# EasyEDA Pro project usb-2.0-hub.epro

# Schematic Schematic1
Board Name: Board1; Create Date: 2025-09-09; Page Name: P1; Project Name: USB拓展坞（2.0）; Schematic Name: Schematic1; Update Date: 2025-09-09; Company: 嘉立创EDA; Page Size: A4; Version: V1.0
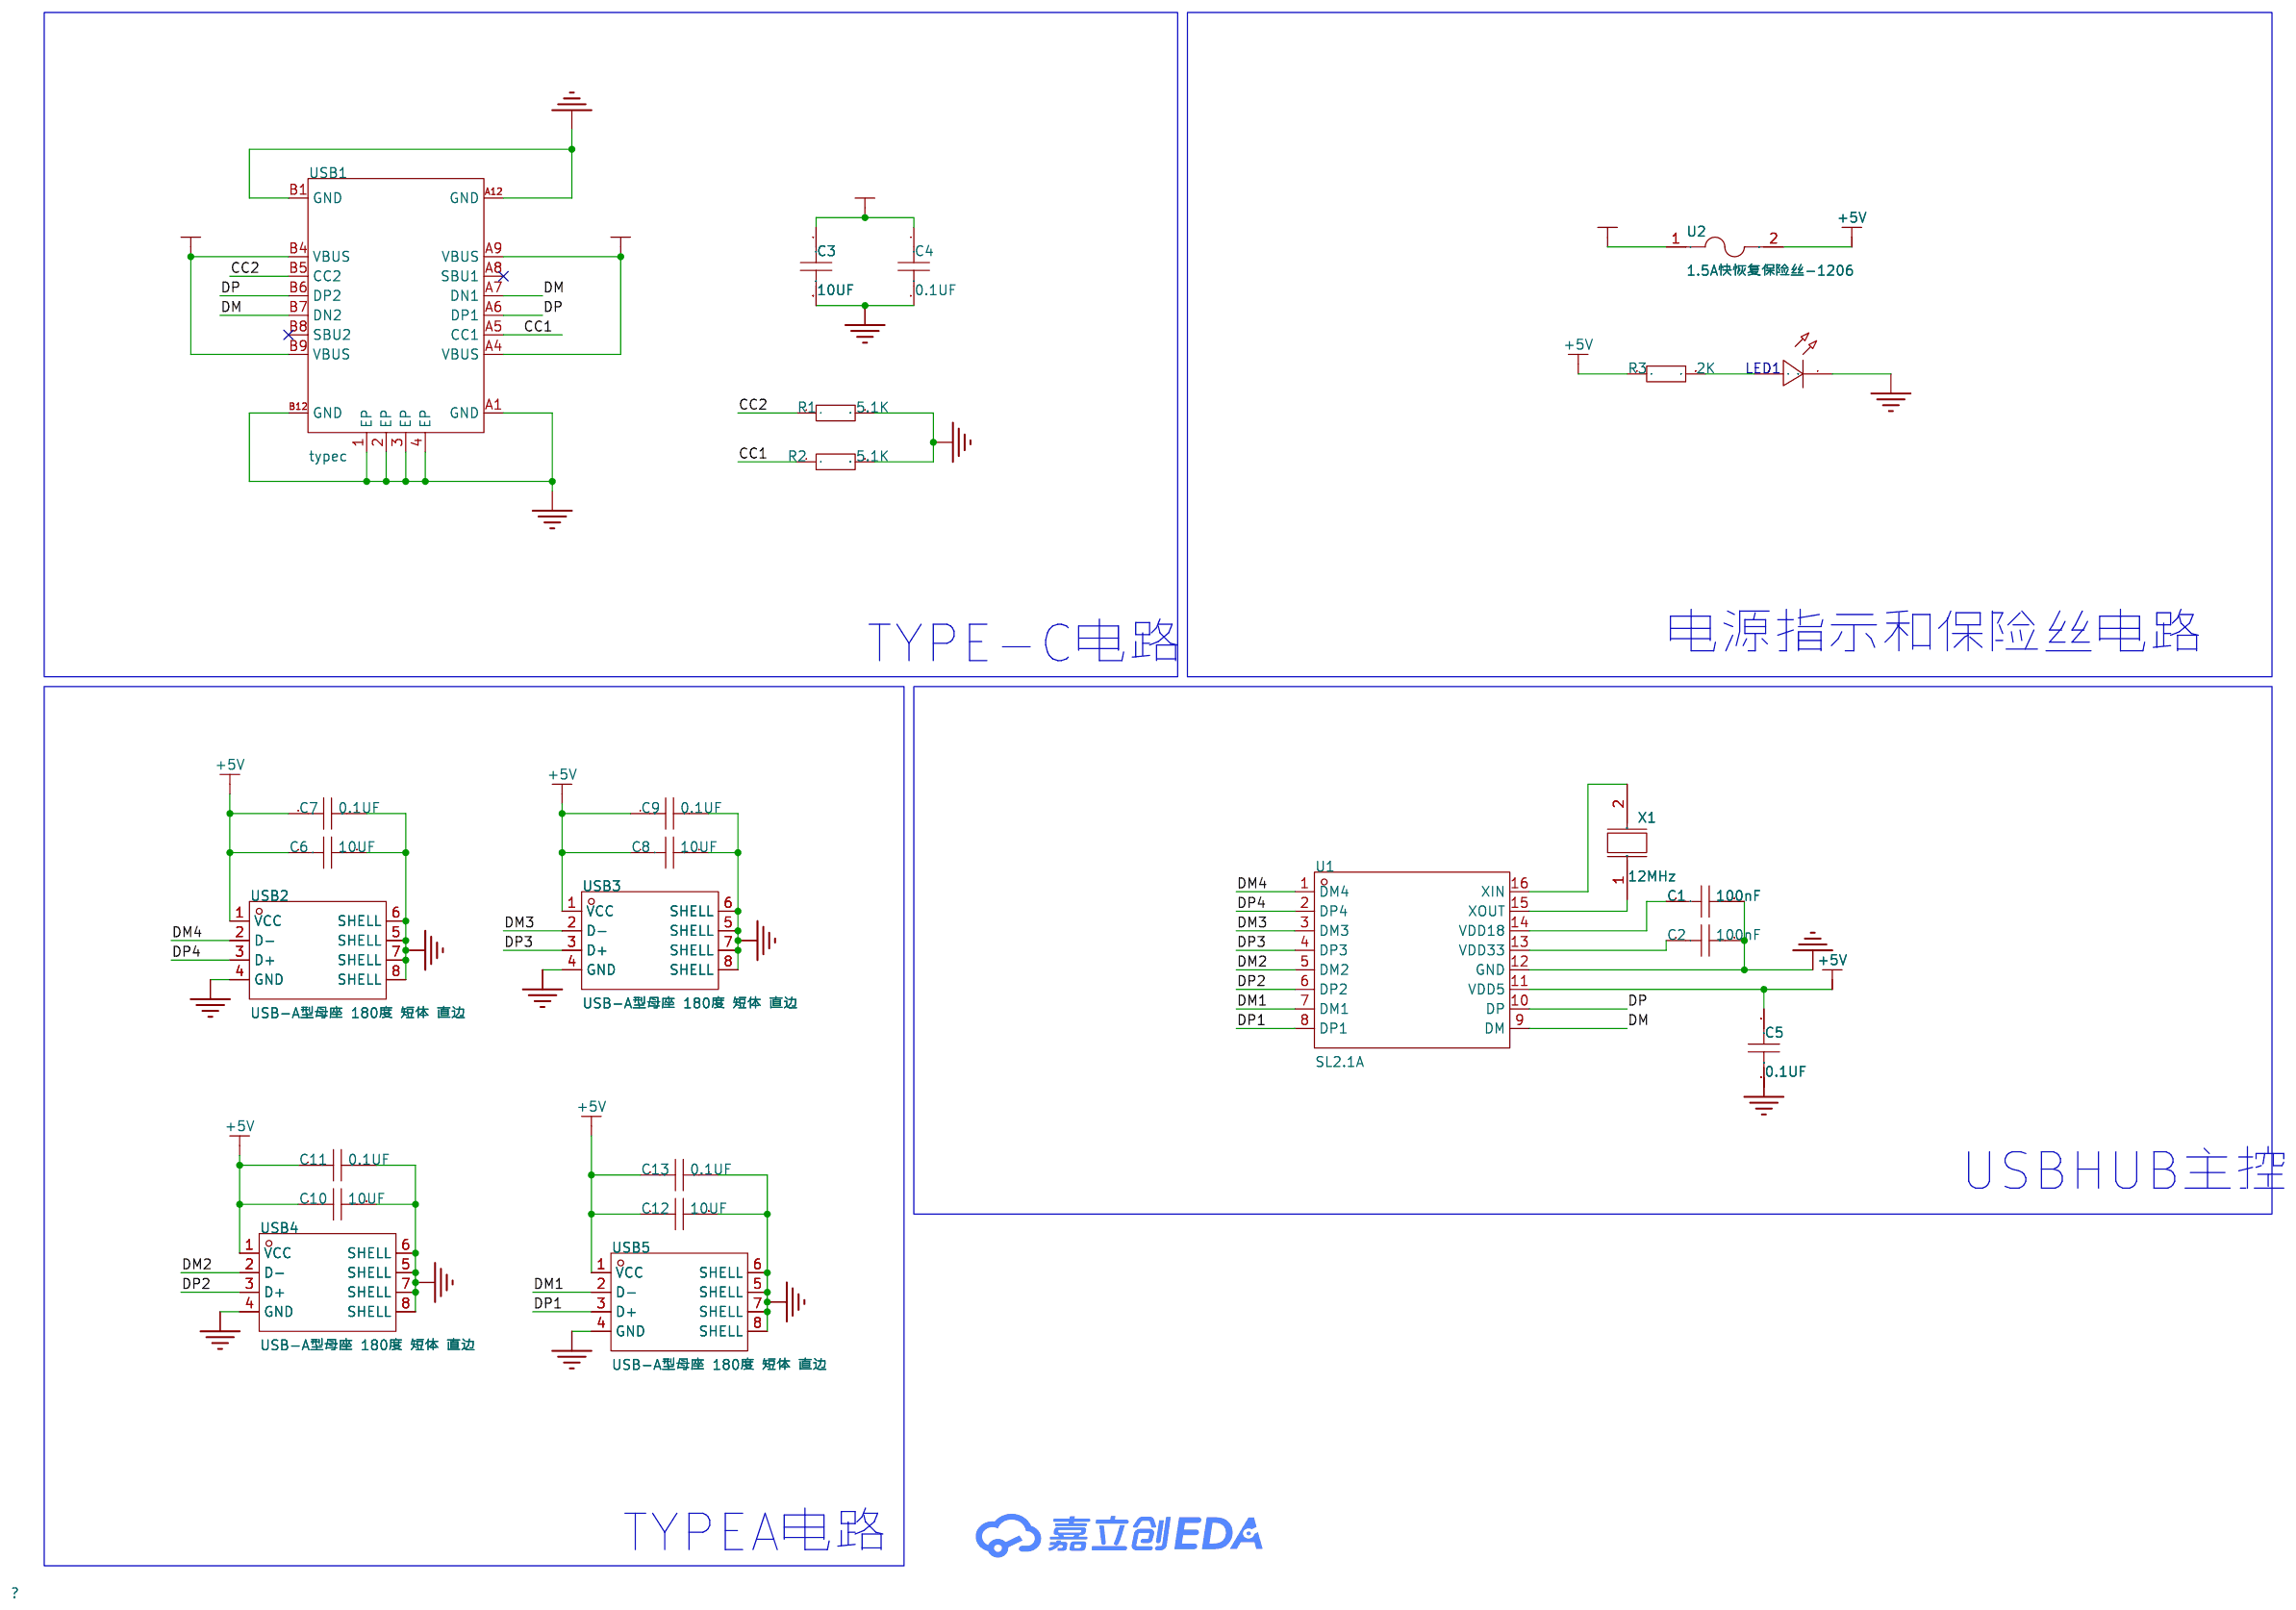
[diagram p0: schematic sheet]

## Parts
C1  100nF  [C0805]
C2  100nF  [C0805]
C3  10UF  [C0805]
C4  0.1UF  [C0805]
C5  0.1UF  [C0805]
C6  10UF  [C0805]
C7  0.1UF  [C0805]
C8  10UF  [C0805]
C9  0.1UF  [C0805]
C10  10UF  [C0805]
C11  0.1UF  [C0805]
C12  10UF  [C0805]
C13  0.1UF  [C0805]
LED1  -  [LED_0805]
R1  5.1K  [R0805]
R2  5.1K  [R0805]
R3  2K  [R0805]
U1  SL2.1A  [SOP-16_L10.0-W3.9-P1.27-LS6.0-BL]
U2  1.5A快恢复保险丝-1206  [F1206]
USB1  typec  [USB-C-SMD_KH-TYPE-C-16P]
USB2  USB-A型母座 180度 短体 直边  [USB-A-SMD_WT_C9900004571]
USB3  USB-A型母座 180度 短体 直边  [USB-A-SMD_WT_C9900004571]
USB4  USB-A型母座 180度 短体 直边  [USB-A-SMD_WT_C9900004571]
USB5  USB-A型母座 180度 短体 直边  [USB-A-SMD_WT_C9900004571]
X1  12MHz  [CRYSTAL-SMD_L5.0-W3.2-1-A]

## Library data of the parts
C1-C13 = CAP_0805: Supplier Footprint: 0805
LED1 = LED_0805-G: Supplier Footprint: 0805
R1-R3 = Res_0805: Supplier Footprint: 0805
U1 = SL2.1A: SL2.1A是一颗高集成度,高性能,低功耗的USB2.0集线器主控芯片，支持USB2.0高速(480MHz),全速(12MHz)和低速模式(1.5MHz)，内置12MHz晶体振荡器。; LCSC Part Name: USB2.0高速4端口HUB控制器; Supplier Part: C192893; Manufacturer: CoreChips(和芯润德); Supplier Footprint: SOP-16; JLCPCB Part Class: 扩展库; Datasheet: https://item.szlcsc.com/datasheet/SL2.1A/225853.html; Supplier: LCSC
U2 = 1.5A快恢复保险丝-1206: Supplier Part: C9900012139; JLCPCB Part Class: 扩展库; Supplier: LCSC
USB1 = typec: Supplier Part: C9900016956; Supplier Footprint: typec 12p; JLCPCB Part Class: 扩展库; Supplier: LCSC
USB2-USB5 = USB-A型母座 180度 短体 直边: Supplier Part: C9900004571; Supplier Footprint: SMD; JLCPCB Part Class: 扩展库; Supplier: LCSC
X1 = 12MHz: Supplier Part: C9900003079; Supplier Footprint: CRYSTAL5032-2P; JLCPCB Part Class: 扩展库; Supplier: LCSC

## Nets
+5V: C5.1 C6.1 C7.1 C8.1 C9.1 C10.1 C11.1 C12.1 C13.1 R3.1 U1.11(VDD5) U2.2 USB2.1(VCC) USB3.1(VCC) USB4.1(VCC) USB5.1(VCC)
GND: C1.2 C2.2 C3.2 C4.2 C5.2 C6.2 C7.2 C8.2 C9.2 C10.2 C11.2 C12.2 C13.2 LED1.1(C) R1.2 R2.2 U1.12(GND) USB1.1(EP) USB1.2(EP) USB1.3(EP) USB1.4(EP) USB1.A1(GND) USB1.A12(GND) USB1.B1(GND) USB1.B12(GND) USB2.4(GND) USB2.5(SHELL) USB2.6(SHELL) USB2.7(SHELL) USB2.8(SHELL) USB3.4(GND) USB3.5(SHELL) USB3.6(SHELL) USB3.7(SHELL) USB3.8(SHELL) USB4.4(GND) USB4.5(SHELL) USB4.6(SHELL) USB4.7(SHELL) USB4.8(SHELL) USB5.4(GND) USB5.5(SHELL) USB5.6(SHELL) USB5.7(SHELL) USB5.8(SHELL)
VCC+5V: C3.1 C4.1 U2.1 USB1.A4(VBUS) USB1.A9(VBUS) USB1.B4(VBUS) USB1.B9(VBUS)
CC1: R2.1 USB1.A5(CC1)
CC2: R1.1 USB1.B5(CC2)
DM: U1.9(DM) USB1.A7(DN1) USB1.B7(DN2)
DM1: U1.7(DM1) USB5.2(D-)
DM2: U1.5(DM2) USB4.2(D-)
DM3: U1.3(DM3) USB3.2(D-)
DM4: U1.1(DM4) USB2.2(D-)
DP: U1.10(DP) USB1.A6(DP1) USB1.B6(DP2)
DP1: U1.8(DP1) USB5.3(D+)
DP2: U1.6(DP2) USB4.3(D+)
DP3: U1.4(DP3) USB3.3(D+)
DP4: U1.2(DP4) USB2.3(D+)
$1N648: U1.16(XIN) X1.2
$1N652: U1.15(XOUT) X1.1
$1N656: C1.1 U1.14(VDD18)
$1N660: C2.1 U1.13(VDD33)
$1N2672: LED1.2(A) R3.2

Not connected (* = marked no-connect by the designer): USB1 A8(SBU1)* B8(SBU2)*

## Notes on the sheet
- TYPE-C电路
- 电源指示和保险丝电路
- USBHUB主控
- TYPEA电路

# Board PCB1
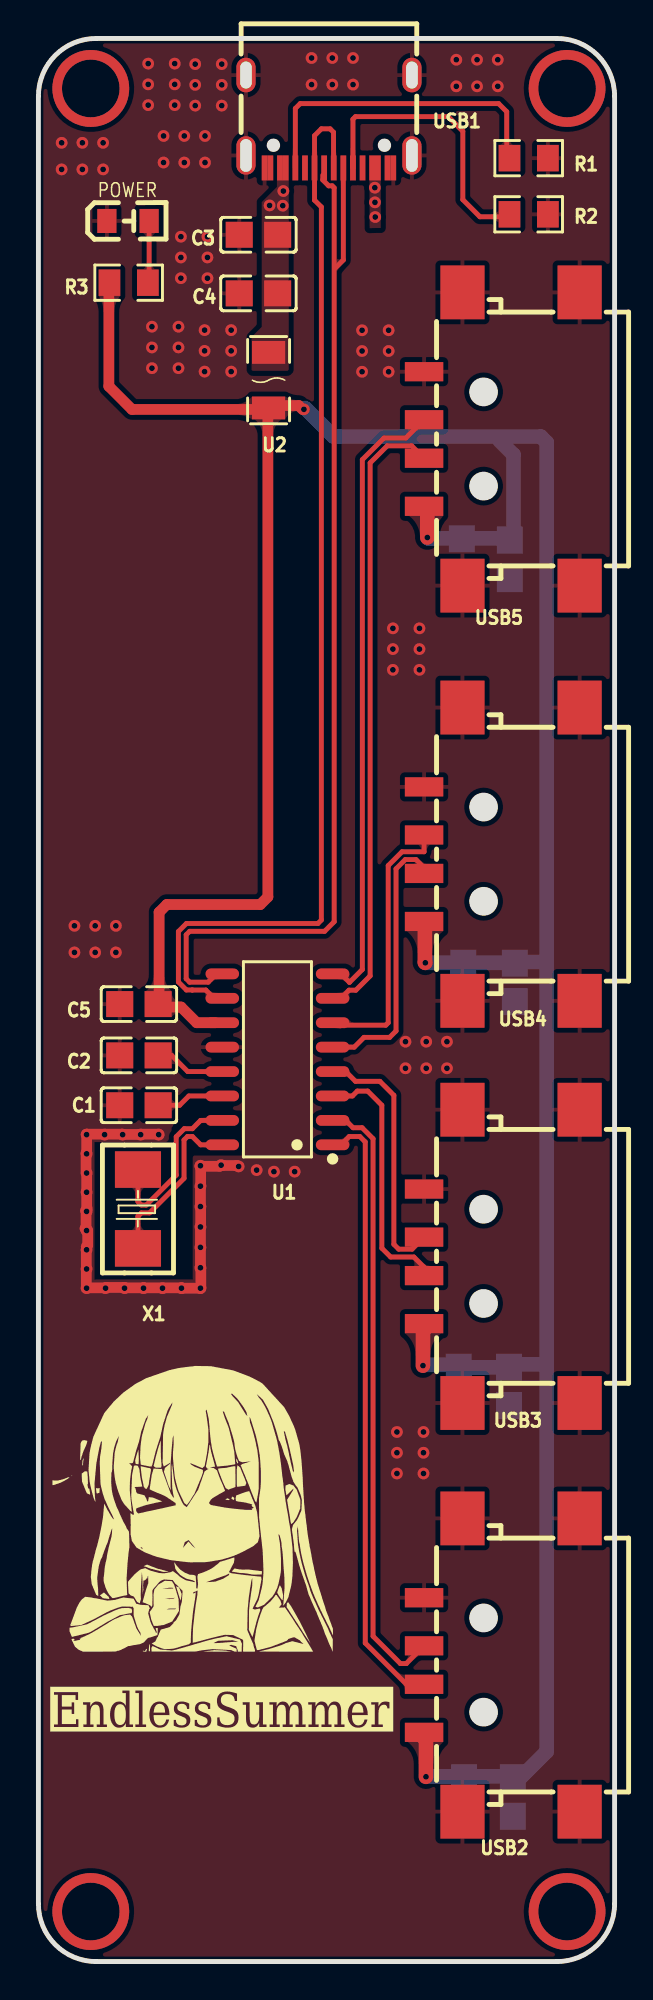
[diagram p1: board, top side]
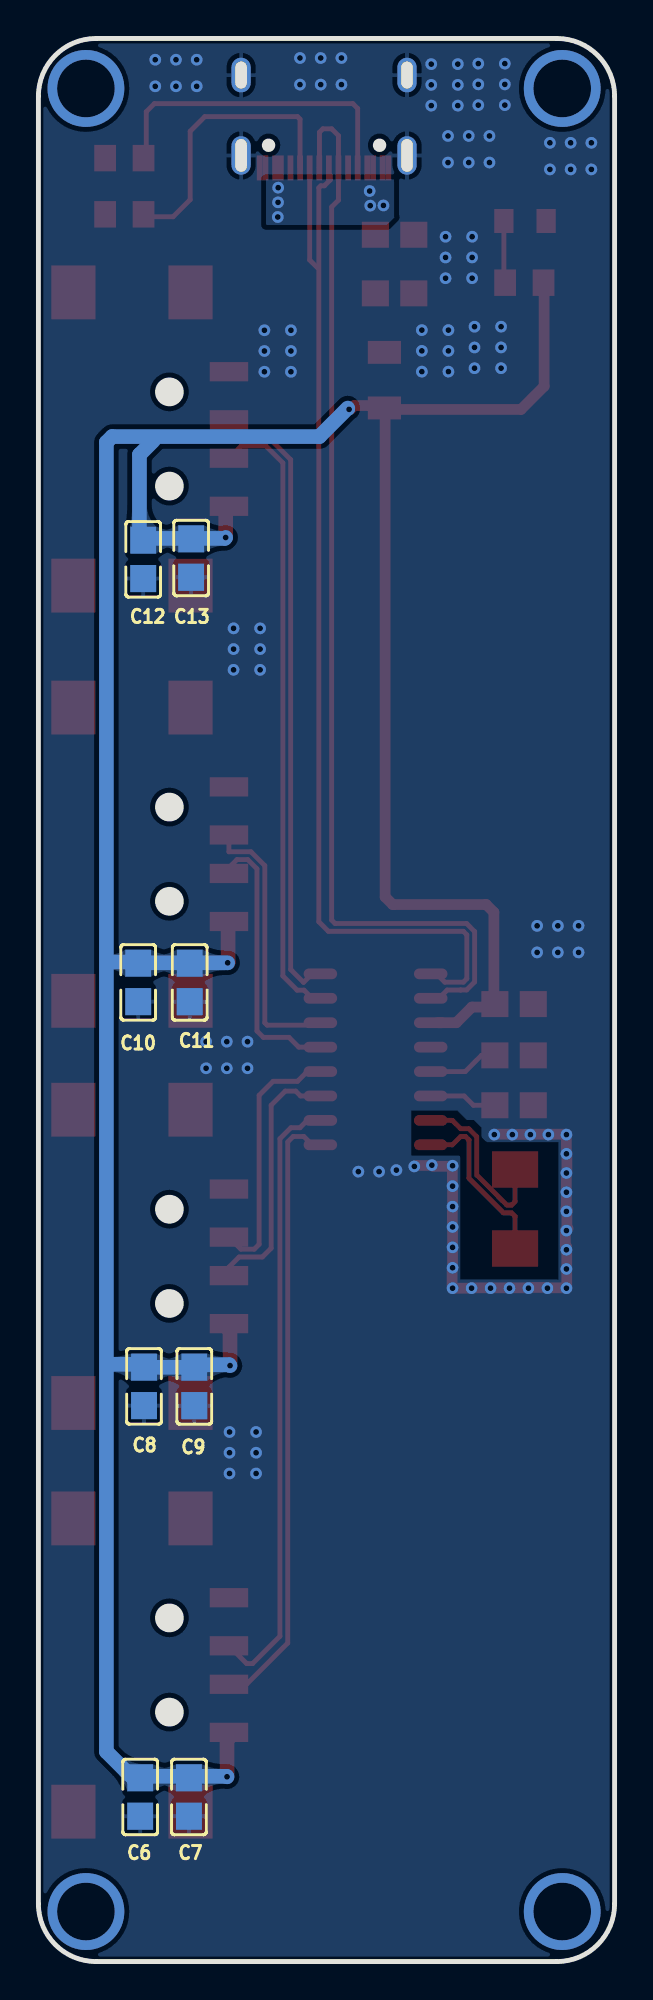
[diagram p2: board, bottom side, seen from below]

Outline 30 x 100 mm; copper layers: Top Layer, Bottom Layer. Coordinates in mm from the lower left corner of the outline.
Outline path: 0,97 0,3 arc(0.88,0.88) 3,0 27,0 arc(29.12,0.88) 30,3 30,97 arc(29.12,99.12) 27,100 3,100 arc(0.88,99.12) 0,97
Stack: Top Layer 0.035mm / Dielectric1 1.51mm FR4 er 4.5 / Bottom Layer 0.035mm

## Design rules (mm)
net DM4: DP4
net DP4: DP4
net DM3: DP3
net DP3: DP3
net DM2: DP2
net DP2: DP2
net DM1: DP1
net DP1: DP1
net $1N648: DP6
net $1N652: DP6
net DP: DP5
net DM: DP5
template: 自定义配置
spacing copperThickness1oz (default): track to track 0.102, other pairs 0 to 0.3
spacing copperThickness2oz: track to track 0.203, other pairs 0.152 to 0.3
track width copperThickness1oz (default): min 0.127, default 0.254, max 2.54
track width copperThickness2oz: min 0.203, default 0.254, max 2.54
differential pair differentialPair (default): width min 0.127, default 0.254, max 2.54; gap min 0.152, default 0.152
via viaSize (default): diameter min 0.5, default 0.61, max 10; hole min 0.3, default 0.305, max 6.3

## Placement (name value [footprint] x y rotation side)
C1  100nF  [C0805]  5.23 44.53 180 top
C2  100nF  [C0805]  5.23 47.12 180 top
C3  10UF  [C0805]  11.46 89.79 180 top
C4  0.1UF  [C0805]  11.46 86.74 180 top
C5  0.1UF  [C0805]  5.23 49.79 180 top
C6  10UF  [C0805]  24.7 8.56 270 bottom
C7  0.1UF  [C0805]  22.16 8.56 270 bottom
C8  10UF  [C0805]  24.5 29.91 270 bottom
C9  0.1UF  [C0805]  21.88 29.91 270 bottom
C10  10UF  [C0805]  24.81 50.92 270 bottom
C11  0.1UF  [C0805]  22.12 50.92 270 bottom
C12  10UF  [C0805]  24.54 72.92 270 bottom
C13  0.1UF  [C0805]  22.05 72.98 270 bottom
LED1  KT-0805G  [LED_0805]  4.72 90.5 0 top
R1  5.1K  [R0805]  25.53 93.78 0 top
R2  5.1K  [R0805]  25.53 90.86 0 top
R3  2K  [R0805]  4.7 87.3 0 top
U1  SL2.1A  [SOP-16_L10.0-W3.9-P1.27-LS6.0-BL]  12.45 46.91 90 top
U2  1.5A快恢复保险丝-1206  [F1206]  11.98 82.23 270 top
USB1  typec  [USB-C-SMD_KH-TYPE-C-16P]  15.13 95.68 180 top
USB2  USB-A型母座 180度 短体 直边  [USB-A-SMD_WT_C9900004571]  24.13 15.42 90 top
USB3  USB-A型母座 180度 短体 直边  [USB-A-SMD_WT_C9900004571]  24.13 36.67 90 top
USB4  USB-A型母座 180度 短体 直边  [USB-A-SMD_WT_C9900004571]  24.13 57.58 90 top
USB5  USB-A型母座 180度 短体 直边  [USB-A-SMD_WT_C9900004571]  24.13 79.17 90 top
X1  12MHz  [CRYSTAL-SMD_L5.0-W3.2-1-A]  5.18 39.13 270 top

## Footprints (pads in the part's own frame, mm; a bottom-side part is the same pattern mirrored in y, then rotated)
C0805
  rect 1.41x1.35 smd: 1(-1,0) 2(1,0)
CRYSTAL-SMD_L5.0-W3.2-1-A
  rect 1.9x2.4 smd: 1(-2.05,0) 2(2.05,0)
F1206
  rect 1.19x1.728 smd: 1(-1.445,0) 2(1.445,0)
LED_0805
  rect 1x1.25 smd: 1(-1.15,0.005) 2(1.05,0.005)
R0805
  rect 1.133x1.377 smd: 1(-1,0) 2(1,0)
SOP-16_L10.0-W3.9-P1.27-LS6.0-BL
  oval 0.56x1.745 smd: 1(-4.445,-2.873) 2(-3.175,-2.873) 3(-1.905,-2.873) 4(-0.635,-2.873) 5(0.635,-2.873) 6(1.905,-2.873) 7(3.175,-2.873) 8(4.445,-2.873) 9(4.445,2.873) 10(3.175,2.873) 11(1.905,2.873) 12(0.635,2.873) 13(-0.635,2.873) 14(-1.905,2.873) 15(-3.175,2.873) 16(-4.445,2.873)
USB-A-SMD_WT_C9900004571
  rect 1x2 smd: 1(-3.5,4.05) 2(-1,4.05) 3(1,4.05) 4(3.5,4.05)
  rect 2.8x2.3 smd: 5(-7.625,2.05) 6(-7.625,-4.05) 7(7.625,-4.05) 8(7.625,2.05)
USB-C-SMD_KH-TYPE-C-16P
  oval 1x2 hole 0.6x1.7: 1(-4.32,1.765) 2(4.32,1.765)
  oval 1x1.8 hole 0.6x1.4: 3(-4.32,-2.415) 4(4.32,-2.415)
  rect 0.3x1.3 smd: A1(-3.35,2.415) A4(-2.55,2.415) A5(-1.25,2.415) A6(-0.25,2.415) A7(0.25,2.415) A8(1.25,2.415) A9(2.55,2.415) A12(3.35,2.415) B1(3.05,2.415) B4(2.25,2.415) B5(1.75,2.415) B6(0.75,2.415) B7(-0.75,2.415) B8(-1.75,2.415) B9(-2.25,2.415) B12(-3.05,2.415)

## Nets
As in the schematic.

Pads without a net: USB1 A8 B8

## Via types
v1: diameter 4, hole 3, Top Layer to Bottom Layer, 4 vias
v2: diameter 0.61, hole 0.305, Top Layer to Bottom Layer, 125 vias

## Routing (per net, layer and track width the routed paths; a pad name or vN(x,y) marks a point on that pad's centre or on a via; arc(x,y) is an arc through that point)
+5V: length 171.4
  Top Layer w0.559: 3.67,87.13 3.67,81.91 4.87,80.71 11.66,80.71 ; 13.76,80.7 13.56,80.91 12.37,80.91 ; 6.28,50.15 6.28,54.56 6.69,54.96 11.55,54.96 11.95,55.36 11.95,80.58 ; 9.21,48.82 8.24,48.82 7.43,49.63 6.03,49.63
  Top Layer w0.762: v2(20.02,30.99) 20.02,32.79 20.16,32.93 ; v2(20.18,9.61) 20.18,11.53 20.05,11.66 ; v2(20.25,74.05) 20.25,75.5 USB5.1 ; 20.12,53.76 20.12,51.96 v2(20.15,51.93)
  Bottom Layer w0.762: 13.89,80.78 15.37,79.3 26.16,79.3 26.46,79 26.46,10.92 25,9.45 ; 26.38,31.06 24.77,31.06 ; 26.32,51.98 24.89,51.98 ; 24.35,30.9 21.81,30.9 ; 24.57,9.63 20.2,9.63 v2(20.18,9.61) ; 24.54,73.99 24.53,74 20.3,74 v2(20.25,74.05) ; 24.54,73.99 24.74,74.18 24.74,78.36 24.02,79.07 ; 24.54,73.99 C12.1 ; v2(20.15,51.93) 24.58,51.93 ; v2(20.02,30.99) 20.07,31.03 21.67,31.03 21.63,31.08
  vias: v2(13.82,80.71)
GND: length 25.5
  Top Layer w0.559: 2.5,35.03 3.51,35.03 3.53,35.05 4.48,35.05 4.5,35.03 5.48,35.03 ; 8.44,39.24 8.44,40.31 8.45,40.32 8.45,41.31 ; 2.42,38.12 2.48,38.06 ; 8.41,41.35 8.42,41.34 ; 8.46,36.06 8.46,35.03 8.44,35.01 7.47,35.01 7.45,35.03 5.48,35.03 ; 2.48,39.04 2.48,38.12 ; 2.49,35.12 2.49,36.97 ; 5.48,35.03 5.49,35.02 ; 8.44,37.18 8.44,38.18 8.45,38.19 8.45,39.22 ; 2.51,39.14 2.51,40.97 ; 10.35,41.37 10.33,41.39 9.48,41.39 9.44,41.35 8.44,41.35 ; 5.32,43.02 6.26,43.02 ; 2.49,37.17 2.56,37.25 2.56,38.04 ; 2.45,39.06 2.54,39.14 ; 2.48,41.11 2.48,42.04 2.51,42.07 2.51,43.02 4.34,43.02 4.36,43.01 5.28,43.01 ; 8.44,36.11 8.44,37.17
  vias: v2(1.21,94.57) v2(1.21,93.19) v2(1.88,53.86) v2(1.88,52.47) v2(2.29,94.57) v2(2.29,93.19) v2(2.51,43) v2(2.51,42) v2(2.51,41) v2(2.51,40) v2(2.51,39.01) v2(2.51,38.01) v2(2.51,37.01) v2(2.51,36.01) v2(2.51,35.02) v2(2.96,53.86) v2(2.96,52.47) v2(3.37,94.57) v2(3.37,93.19) v2(3.45,43) v2(3.5,35.02) v2(4.03,53.86) v2(4.03,52.47) v2(4.39,43) v2(4.48,35.02) v2(5.32,43) v2(5.47,35.02) v2(5.71,98.69) v2(5.71,97.61) v2(5.71,96.53) v2(5.91,85.01) v2(5.91,83.93) v2(5.91,82.85) v2(6.26,43) v2(6.46,35.02) v2(6.52,94.93) v2(6.52,93.55) v2(7.1,98.69) v2(7.1,97.61) v2(7.1,96.53) v2(7.29,85.01) v2(7.29,83.93) v2(7.29,82.85) v2(7.42,89.69) v2(7.42,88.61) v2(7.42,87.53) v2(7.45,35.02) v2(7.59,94.93) v2(7.59,93.55) v2(8.16,98.67) v2(8.16,97.59) v2(8.16,96.51) v2(8.44,41.38) v2(8.44,40.32) v2(8.44,39.26) v2(8.44,38.2) v2(8.44,37.14) v2(8.44,36.08) v2(8.44,35.02) v2(8.67,94.93) v2(8.67,93.55) v2(8.65,84.83) v2(8.65,83.75) v2(8.65,82.68) v2(8.8,89.69) v2(8.8,88.61) v2(8.8,87.53) v2(9.55,98.67) v2(9.55,97.59) v2(9.55,96.51) v2(9.51,41.41) v2(10.04,84.83) v2(10.04,83.75) v2(10.04,82.68) v2(10.43,41.35) v2(11.36,41.15) v2(12.26,41.08) v2(13.34,41.08) v2(14.22,98.98) v2(14.22,97.6) v2(15.3,98.98) v2(15.3,97.6) v2(16.38,98.98) v2(16.38,97.6) v2(16.85,84.83) v2(16.85,83.75) v2(16.85,82.67) v2(18.23,84.83) v2(18.23,83.75) v2(18.23,82.67) v2(18.46,69.33) v2(18.46,68.25) v2(18.46,67.17) v2(18.67,27.54) v2(18.67,26.46) v2(18.67,25.38) v2(19.11,47.83) v2(19.11,46.45) v2(19.84,69.33) v2(19.84,68.25) v2(19.84,67.17) v2(20.05,27.54) v2(20.05,26.46) v2(20.05,25.38) v2(20.19,47.83) v2(20.19,46.45) v2(21.27,47.83) v2(21.27,46.45) v2(21.76,98.89) v2(21.76,97.51) v2(22.84,98.89) v2(22.84,97.51) v2(23.92,98.89) v2(23.92,97.51)
VCC+5V:
  vias: v2(12.04,91.32) v2(12.75,92.07) v2(12.72,91.31) v2(17.52,92.24) v2(17.52,91.48) v2(17.54,90.72)
(no net):
  vias: v1(2.73,97.4) v1(2.73,2.6) v1(27.53,97.4) v1(27.53,2.6)
CC1: length 15
  Top Layer w0.254: USB1.A5 16.38,95.8 16.51,95.94 21.34,95.94 22.1,95.17 22.1,91.62 22.99,90.73 24.4,90.73 R2.1
CC2: length 16.9
  Top Layer w0.254: USB1.B5 13.38,96.36 13.63,96.61 23.96,96.61 24.38,96.19 24.38,93.92 R1.1
DM: length 56.9
  Top Layer w0.254: USB1.B7 15.88,88.48 15.47,88.08 ; 14.81,92.89 14.81,92.64 15.11,92.34 15.3,92.34 15.4,92.24 15.4,54.07 14.9,53.57 7.87,53.57 7.69,53.39 7.69,51.11 7.87,50.93 8.84,50.93 9.27,51.36 U1.9
DM1: length 32.6
  Top Layer w0.254: U1.7 15.75,50.09 16.17,50.51 16.53,50.51 17.27,51.25 17.27,77.93 18.16,78.82 19.43,78.82 USB5.2
DM2: length 14.2
  Top Layer w0.254: U1.5 16.45,47.55 16.95,48.06 18.29,48.06 18.62,48.39 18.62,56.82 19.1,57.3 19.66,57.3 20.08,56.88 USB4.2
DM3: length 13.5
  Top Layer w0.254: USB3.2 20.08,36.11 19.55,36.64 18.34,36.64 17.88,37.09 17.88,44.53 17.15,45.26 16.6,45.26 16.35,45.01 U1.3
DM4: length 32
  Top Layer w0.254: U1.1 15.75,42.47 16.18,42.9 16.74,42.9 17.02,42.62 17.02,16.56 19.16,14.42 USB2.2
DP: length 57
  Top Layer w0.254: USB1.A6 15.37,93.28 15.37,95.12 15.19,95.3 14.73,95.3 14.38,94.95 USB1.B6 14.38,91.59 14.73,91.24 14.73,54.16 14.55,53.98 7.71,53.98 7.29,53.56 7.29,50.94 7.71,50.52 8.02,50.52 8.02,50.52 8.72,50.52 9.14,50.09 U1.10
DP1: length 32.6
  Top Layer w0.254: USB5.3 19.13,79.22 17.99,79.22 16.87,78.1 16.87,51.59 16.2,50.92 15.75,51.36 U1.8
DP2: length 14.2
  Top Layer w0.254: U1.6 15.45,48.69 18.09,48.69 18.21,48.82 18.21,56.99 18.93,57.71 20.08,57.71 USB4.3
DP3: length 13.4
  Top Layer w0.254: 20.08,37.67 19.45,37.04 18.76,37.04 18.51,37.3 18.51,45.04 17.78,45.77 16.51,45.77 16,46.28 U1.4
DP4: length 32
  Top Layer w0.254: U1.2 16,43.74 16.38,43.36 16.85,43.36 17.42,42.79 17.42,16.92 18.85,15.49 19.16,15.49 USB2.3
$1N648: length 9.1
  Top Layer w0.254: U1.16 8.45,42.47 8.02,42.9 7.76,42.9 7.58,42.72 7.58,40.73 5.79,38.93 5.36,38.93 5.18,38.75 X1.2
$1N652: length 9.1
  Top Layer w0.254: X1.1 5.18,39.52 5.36,39.34 5.62,39.34 7.18,40.89 7.18,42.89 7.59,43.31 8.02,43.31 8.45,43.74 U1.15
$1N656: length 3.5
  Top Layer w0.254: C1.1 7.35,44.53 7.83,45.01 U1.14
$1N660: length 3.7
  Top Layer w0.254: C2.1 6.93,47.12 7.77,46.28 U1.13
$1N2672: length 3.2
  Top Layer w0.254: R3.2 5.77,87.37 LED1.2

## Copper pours and planes (outline as drawn; the poured copper is in the pictures)
GND on Top Layer: -10.4,106.69 40.9,106.69 40.9,-9.62 -10.4,-9.62
GND on Bottom Layer: -13.45,108.72 48.26,108.72 48.26,-22.07 -13.45,-22.07
VCC+5V on Top Layer: 17.23,93.93 17.83,93.93 17.83,90.13 17.23,90.13
VCC+5V on Top Layer: 11.1,93.93 13.03,93.93 13.03,82.71 11.1,82.71
VCC+5V on Bottom Layer: 11.46,92.67 18.16,92.67 18.16,90.31 11.46,90.31

Small or netless copper shapes (teardrops, artwork), in the pictures only: 95 on Top Layer, 17 on Bottom Layer

## Text on the board
Top Silkscreen Layer: POWER | EndlessSummer
